# Altium schematic sheet Top-Sheet.SchDoc
size A4; SheetNumber: 1; SheetTotal: 6
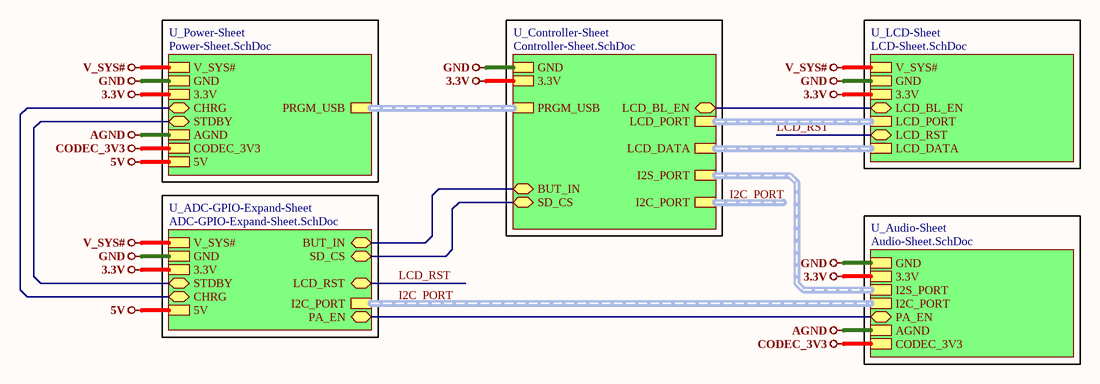
[diagram p0: Top-Sheet.SchDoc]

## Sub-sheets
U_ADC-GPIO-Expand-Sheet = ADC-GPIO-Expand-Sheet.SchDoc: I2C_PORT (harness I2C_PORT), GND, 3.3V, STDBY (bidir), CHRG (bidir), LCD_RST (bidir), SD_CS (bidir), PA_EN (bidir), V_SYS#, 5V, BUT_IN (bidir)
U_Audio-Sheet = Audio-Sheet.SchDoc: GND, 3.3V, I2S_PORT (harness I2S_PORT), I2C_PORT (harness I2C_PORT), PA_EN (bidir), AGND, CODEC_3V3
U_Controller-Sheet = Controller-Sheet.SchDoc: LCD_DATA (harness LCD_DATA), GND, 3.3V, I2C_PORT (harness I2C_PORT), I2S_PORT (harness I2S_PORT), LCD_PORT (harness LCD_PORT), PRGM_USB (harness PRGM_USB), SD_CS (bidir), LCD_BL_EN (bidir), BUT_IN (bidir)
U_LCD-Sheet = LCD-Sheet.SchDoc: V_SYS#, GND, 3.3V, LCD_BL_EN (bidir), LCD_PORT (harness LCD_PORT), LCD_RST (bidir), LCD_DATA (harness LCD_DATA)
U_Power-Sheet = Power-Sheet.SchDoc: V_SYS#, GND, PRGM_USB (harness PRGM_USB), 3.3V, STDBY (bidir), CHRG (bidir), AGND, CODEC_3V3, 5V

## Nets
3.3V: sheet U_LCD-Sheet/3.3V, sheet U_Audio-Sheet/3.3V, sheet U_Power-Sheet/3.3V, sheet U_Controller-Sheet/3.3V, sheet U_ADC-GPIO-Expand-Sheet/3.3V
5V: sheet U_Power-Sheet/5V, sheet U_ADC-GPIO-Expand-Sheet/5V
AGND: sheet U_Audio-Sheet/AGND, sheet U_Power-Sheet/AGND
CODEC_3V3: sheet U_Audio-Sheet/CODEC_3V3, sheet U_Power-Sheet/CODEC_3V3
GND: sheet U_LCD-Sheet/GND, sheet U_Audio-Sheet/GND, sheet U_Power-Sheet/GND, sheet U_Controller-Sheet/GND, sheet U_ADC-GPIO-Expand-Sheet/GND
V_SYS#: sheet U_LCD-Sheet/V_SYS#, sheet U_Power-Sheet/V_SYS#, sheet U_ADC-GPIO-Expand-Sheet/V_SYS#
LCD_RST: sheet U_LCD-Sheet/LCD_RST, sheet U_ADC-GPIO-Expand-Sheet/LCD_RST
(unnamed): sheet U_LCD-Sheet/LCD_BL_EN, sheet U_Controller-Sheet/LCD_BL_EN
(unnamed): sheet U_Audio-Sheet/PA_EN, sheet U_ADC-GPIO-Expand-Sheet/PA_EN
(unnamed): sheet U_Power-Sheet/STDBY, sheet U_ADC-GPIO-Expand-Sheet/STDBY
(unnamed): sheet U_Power-Sheet/CHRG, sheet U_ADC-GPIO-Expand-Sheet/CHRG
(unnamed): sheet U_Controller-Sheet/SD_CS, sheet U_ADC-GPIO-Expand-Sheet/SD_CS
(unnamed): sheet U_Controller-Sheet/BUT_IN, sheet U_ADC-GPIO-Expand-Sheet/BUT_IN

## Buses and harness runs
harness I2C_PORT = sheet U_ADC-GPIO-Expand-Sheet/I2C_PORT = sheet U_Audio-Sheet/I2C_PORT
harness I2C_PORT = sheet U_Controller-Sheet/I2C_PORT
harness sheet U_Audio-Sheet/I2S_PORT = sheet U_Controller-Sheet/I2S_PORT
harness sheet U_Controller-Sheet/LCD_DATA = sheet U_LCD-Sheet/LCD_DATA
harness sheet U_Controller-Sheet/LCD_PORT = sheet U_LCD-Sheet/LCD_PORT
harness sheet U_Controller-Sheet/PRGM_USB = sheet U_Power-Sheet/PRGM_USB

## Notes on the sheet
- File:
- Title:
- Date:
- Page
- Num:
- Total:
- Drawn By: Huzaifa Ali